# Altium schematic sheet Schematic1_1.SchDoc (part 1 of 2)
size 594 x 420 mm; SchematicName: Schematic1; PageName: 1; CmpIndex: 0; Symbol name: A2-LIST-1-GA.1; SymIndex: 2
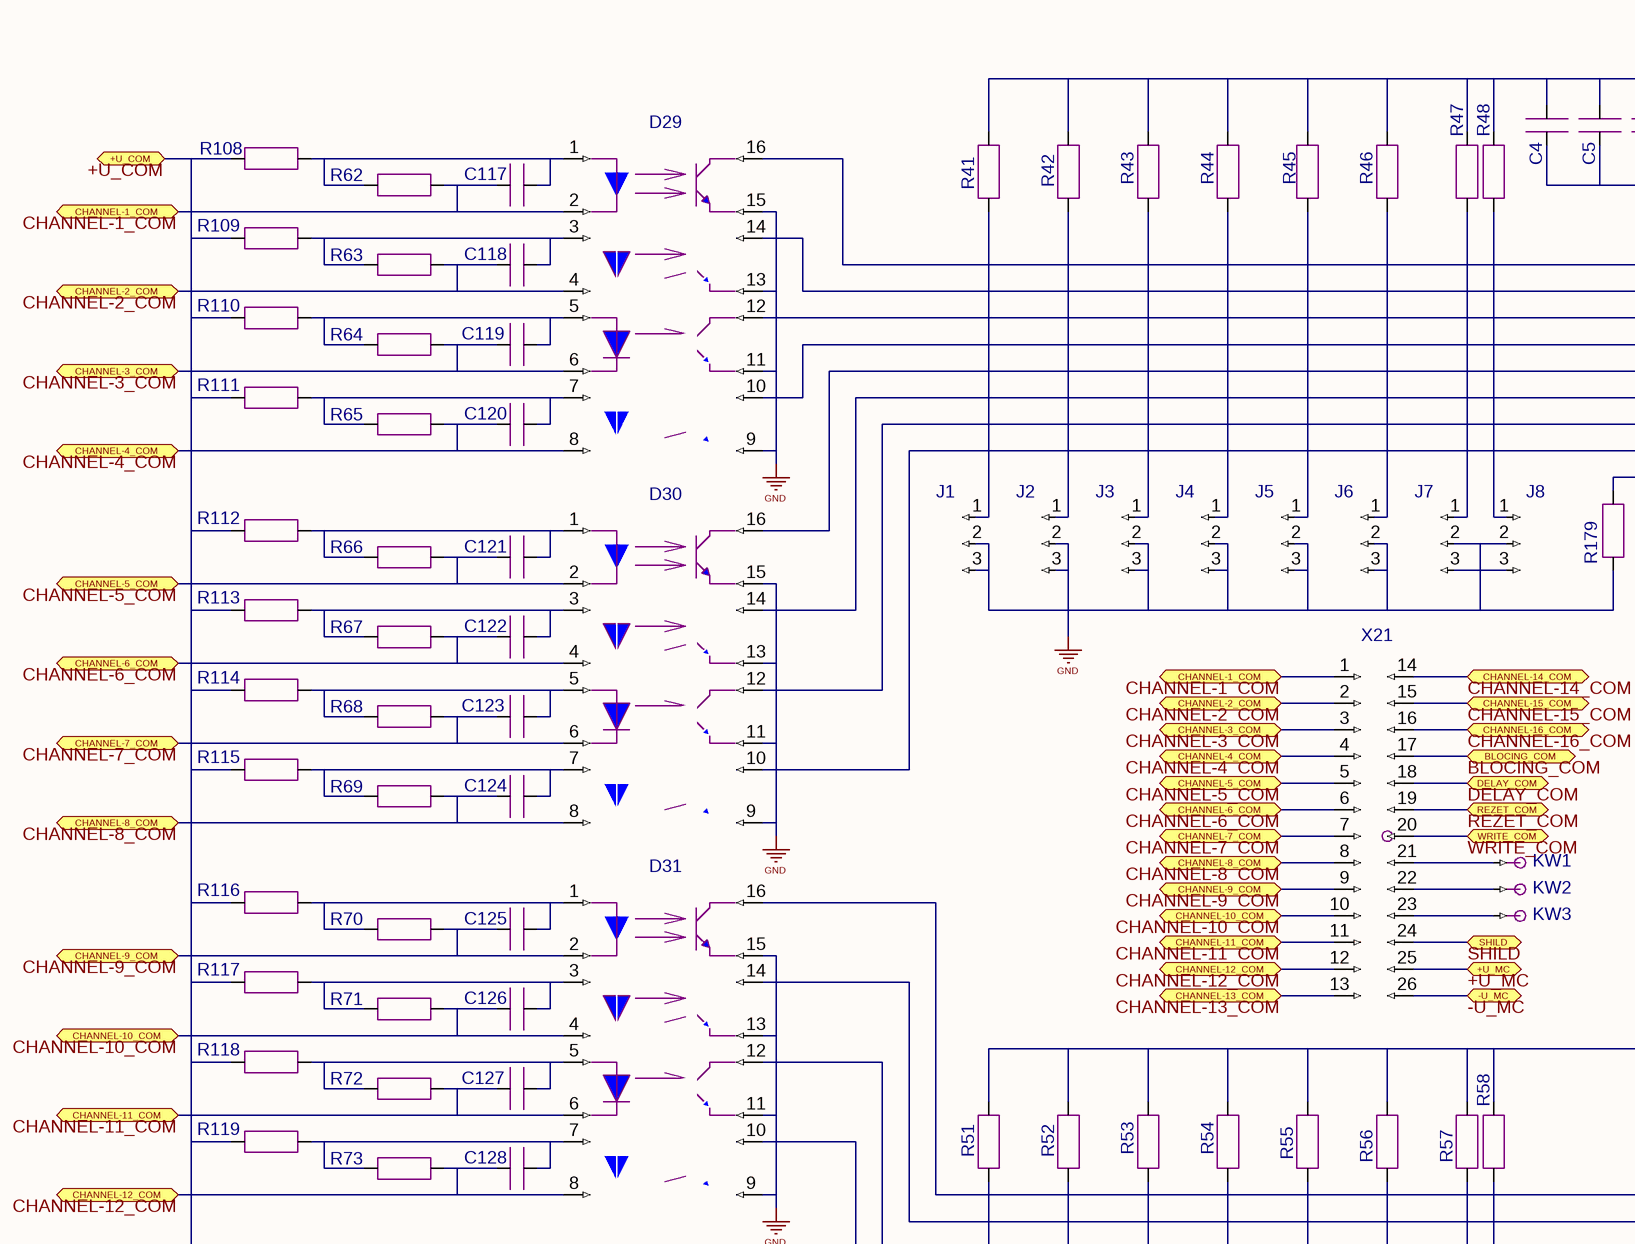
[diagram p0: Schematic1_1.SchDoc, top left]
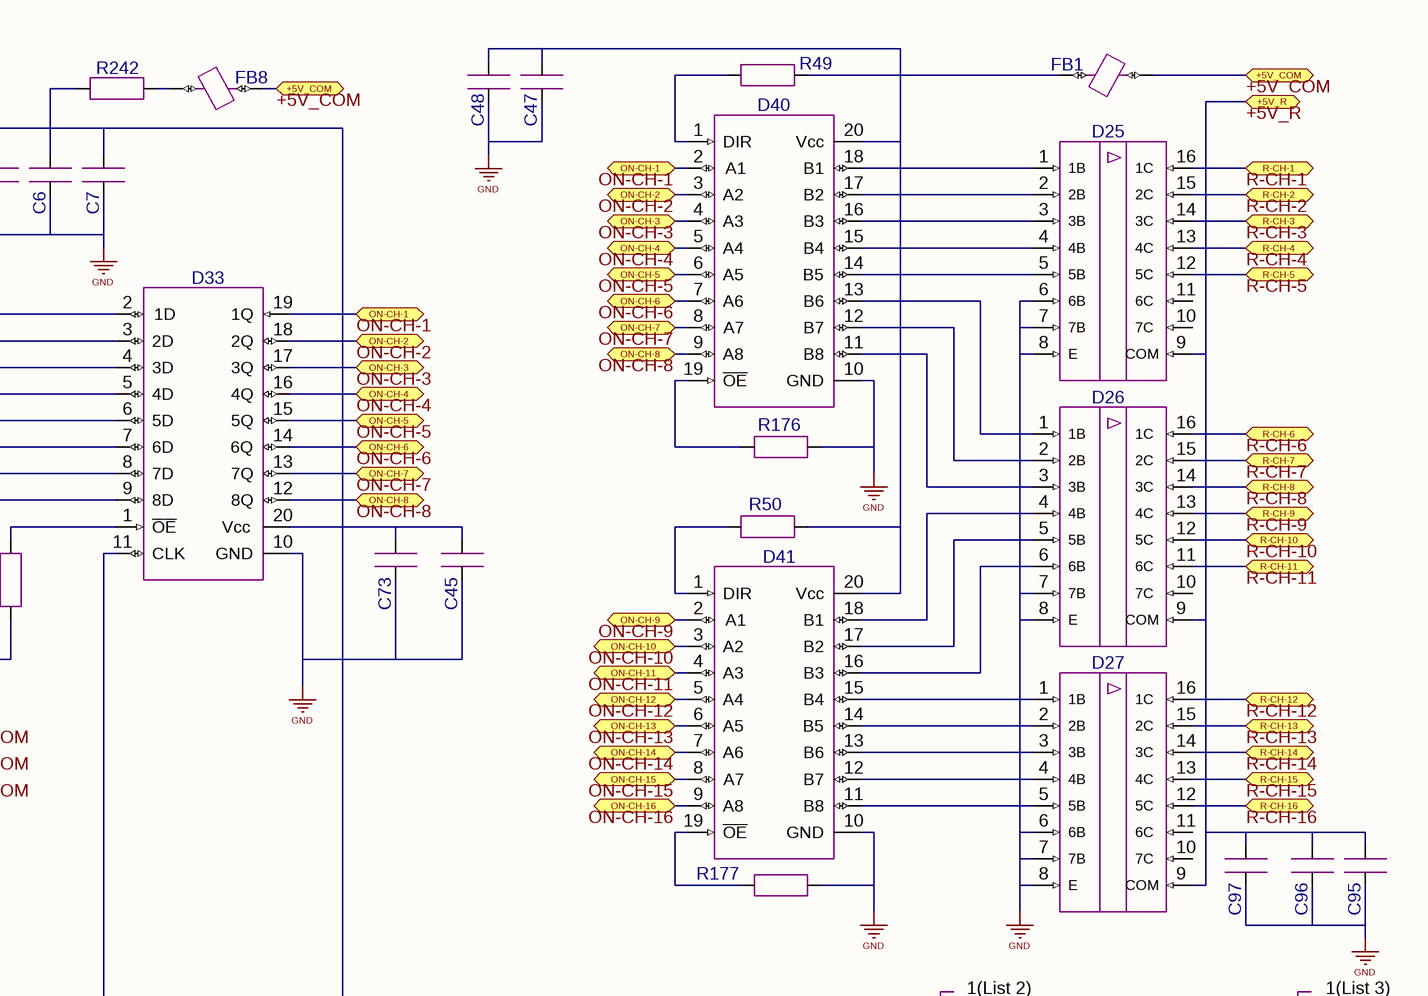
[diagram p1: Schematic1_1.SchDoc, top right]
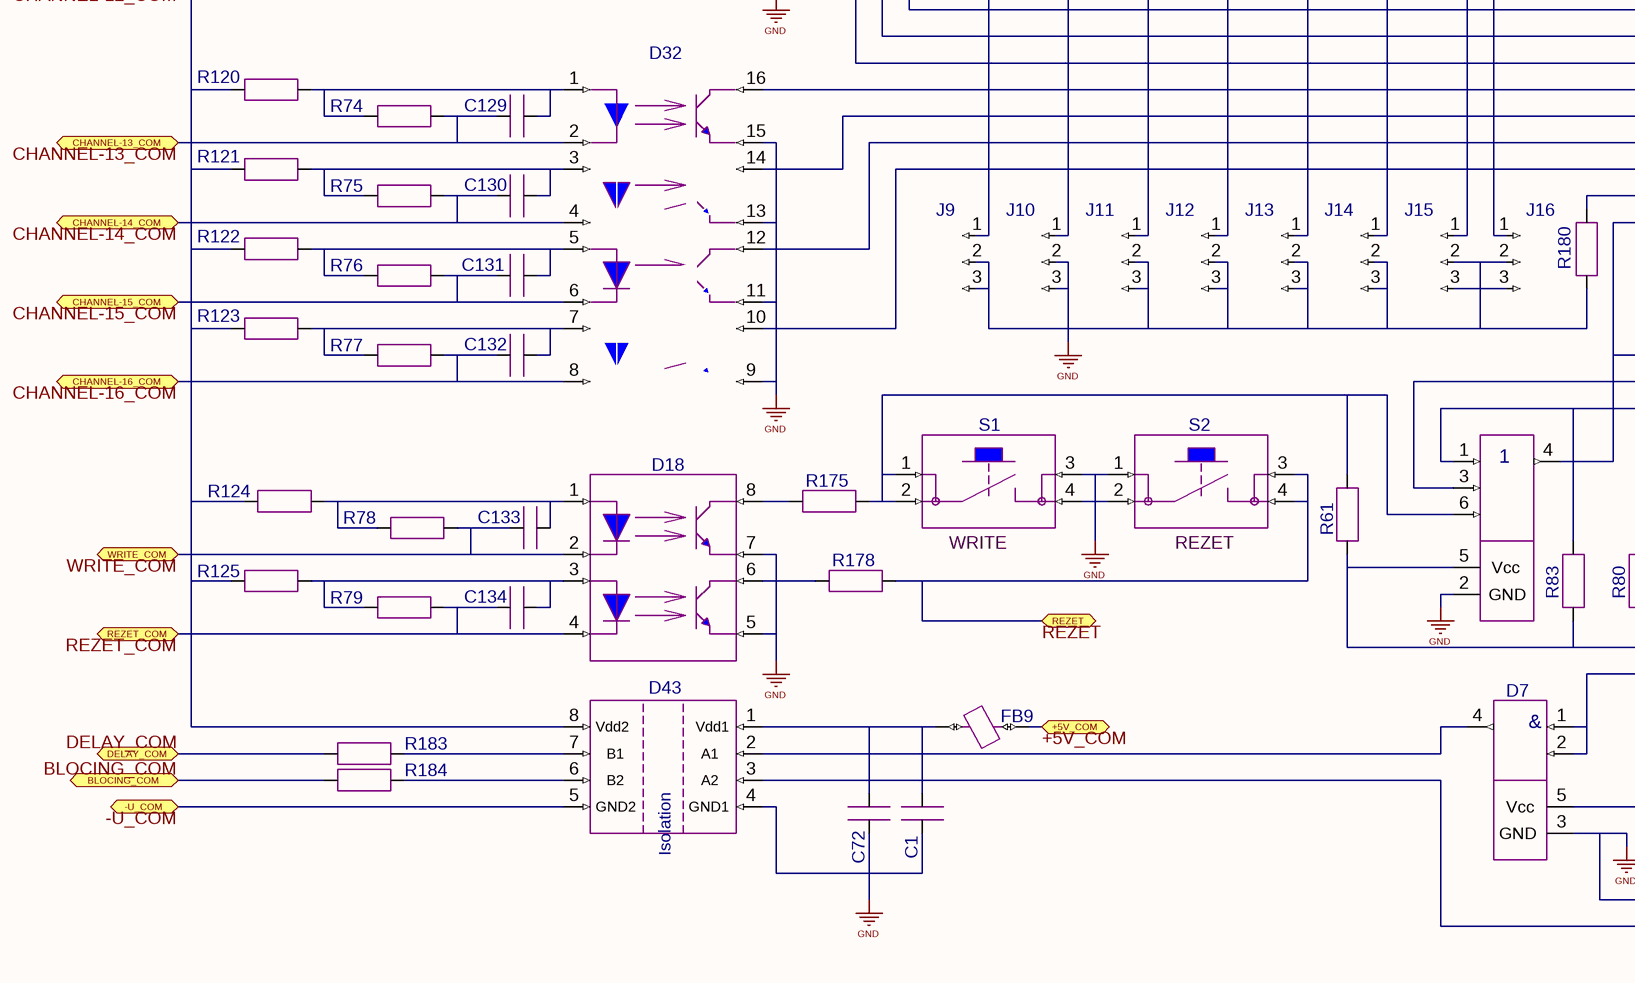
[diagram p2: Schematic1_1.SchDoc, bottom left]
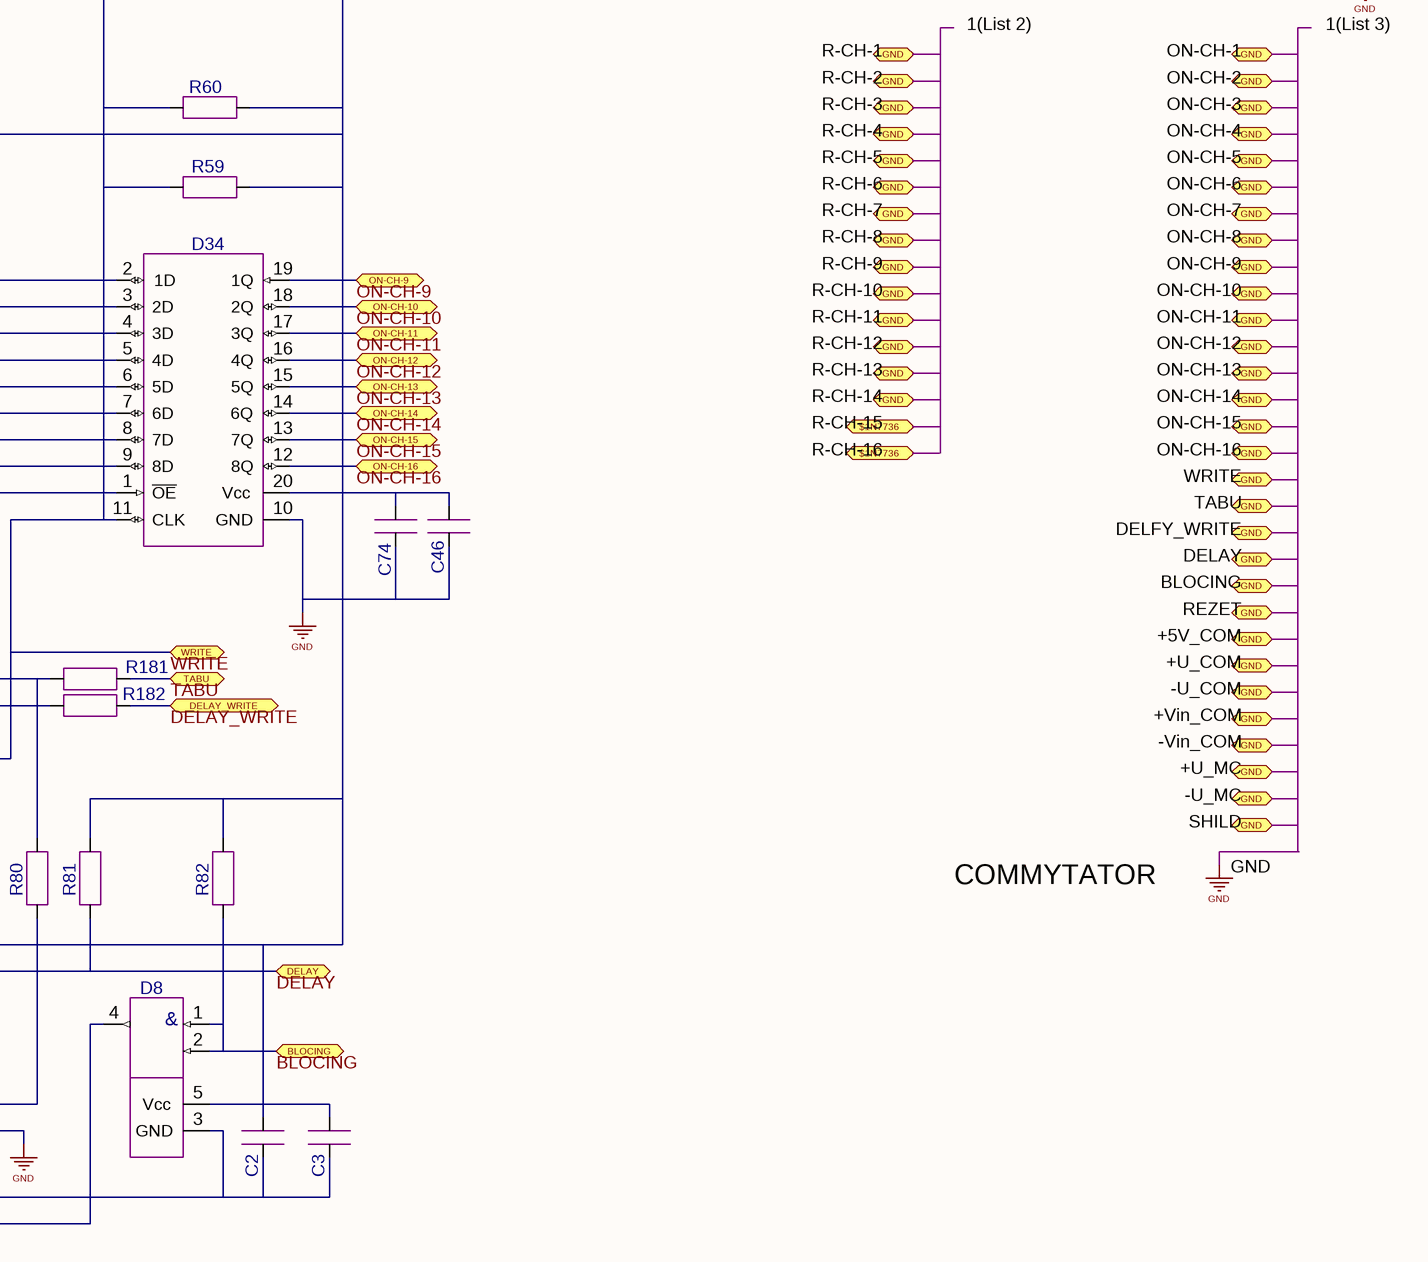
[diagram p3: Schematic1_1.SchDoc, bottom right]

## Parts
C1  CAP CER 0.1UF 50V 10% X7R 0603  (value not drawn)
C2  CAP CER 0.1UF 50V 10% X7R 0603  (value not drawn)
C3  CAP CER 0.1UF 50V 10% X7R 0603  (value not drawn)
C4  CAP CER 0.1UF 50V 10% X7R 0603  (value not drawn)
C5  CAP CER 0.1UF 50V 10% X7R 0603  (value not drawn)
C6  CAP CER 0.1UF 50V 10% X7R 0603  (value not drawn)
C7  CAP CER 0.1UF 50V 10% X7R 0603  (value not drawn)
C45  CAP CER 2.2UF 16V 10% X7R 0805  (value not drawn)
C46  CAP CER 2.2UF 16V 10% X7R 0805  (value not drawn)
C47  CAP CER 2.2UF 16V 10% X7R 0805  (value not drawn)
C48  CAP CER 2.2UF 16V 10% X7R 0805  (value not drawn)
C72  CAP CER 10UF 16V 10% X7R 0805  (value not drawn)
C73  CAP CER 10UF 16V 10% X7R 0805  (value not drawn)
C74  CAP CER 10UF 16V 10% X7R 0805  (value not drawn)
C95  CAP CER 10UF 25V 10% X7R 1210  (value not drawn)
C96  CAP CER 10UF 25V 10% X7R 1210  (value not drawn)
C97  CAP CER 10UF 25V 10% X7R 1210  (value not drawn)
C117  CAP CER 1000PF 50V 5% NP0 0603  (value not drawn)
C118  CAP CER 1000PF 50V 5% NP0 0603  (value not drawn)
C119  CAP CER 1000PF 50V 5% NP0 0603  (value not drawn)
C120  CAP CER 1000PF 50V 5% NP0 0603  (value not drawn)
C121  CAP CER 1000PF 50V 5% NP0 0603  (value not drawn)
C122  CAP CER 1000PF 50V 5% NP0 0603  (value not drawn)
C123  CAP CER 1000PF 50V 5% NP0 0603  (value not drawn)
C124  CAP CER 1000PF 50V 5% NP0 0603  (value not drawn)
C125  CAP CER 1000PF 50V 5% NP0 0603  (value not drawn)
C126  CAP CER 1000PF 50V 5% NP0 0603  (value not drawn)
C127  CAP CER 1000PF 50V 5% NP0 0603  (value not drawn)
C128  CAP CER 1000PF 50V 5% NP0 0603  (value not drawn)
C129  CAP CER 1000PF 50V 5% NP0 0603  (value not drawn)
C130  CAP CER 1000PF 50V 5% NP0 0603  (value not drawn)
C131  CAP CER 1000PF 50V 5% NP0 0603  (value not drawn)
C132  CAP CER 1000PF 50V 5% NP0 0603  (value not drawn)
C133  CAP CER 1000PF 50V 5% NP0 0603  (value not drawn)
C134  CAP CER 1000PF 50V 5% NP0 0603  (value not drawn)
D7  IC GATE AND 1CH 2-INP SOT-23-5  (value not drawn)
D8  IC GATE AND 1CH 2-INP SOT-23-5  (value not drawn)
D18  OPTOISO 2.5KV 2CH TRANS 8SOIC  (value not drawn)
D25  IC DARL TRANS ARRAY 16-SOIC  (value not drawn)
D26  IC DARL TRANS ARRAY 16-SOIC  (value not drawn)
D27  IC DARL TRANS ARRAY 16-SOIC  (value not drawn)
D29  OPTOISO 3KV 4CH TRANS 16SOIC  (value not drawn)
D30  OPTOISO 3KV 4CH TRANS 16SOIC  (value not drawn)
D31  OPTOISO 3KV 4CH TRANS 16SOIC  (value not drawn)
D32  OPTOISO 3KV 4CH TRANS 16SOIC  (value not drawn)
D33  IC D-TYPE POS TRG SNGL 20TSSOP  (value not drawn)
D34  IC D-TYPE POS TRG SNGL 20TSSOP  (value not drawn)
D40  IC BUS TRANSCEIVER DUAL 20TSSOP  (value not drawn)
D41  IC BUS TRANSCEIVER DUAL 20TSSOP  (value not drawn)
D42  IC GATE NOR 1CH 3-INP SOT-23-6  (value not drawn)
D43  IC ISOLATOR 2CH 3.75KV 8SOIC  (value not drawn)
FB1  FERRITE BEAD 1000 OHM 0,4 A 0603  (value not drawn)
FB8  FERRITE BEAD 1800 OHM 0,2 A 0603  (value not drawn)
FB9  FERRITE BEAD 1800 OHM 0,2 A 0603  (value not drawn)
J1  CONN JUMPER SHORTING .100" GOLD  (value not drawn)
J2  CONN JUMPER SHORTING .100" GOLD  (value not drawn)
J3  CONN JUMPER SHORTING .100" GOLD  (value not drawn)
J4  CONN JUMPER SHORTING .100" GOLD  (value not drawn)
J5  CONN JUMPER SHORTING .100" GOLD  (value not drawn)
J6  CONN JUMPER SHORTING .100" GOLD  (value not drawn)
J7  CONN JUMPER SHORTING .100" GOLD  (value not drawn)
J8  CONN JUMPER SHORTING .100" GOLD  (value not drawn)
J9  CONN JUMPER SHORTING .100" GOLD  (value not drawn)
J10  CONN JUMPER SHORTING .100" GOLD  (value not drawn)
J11  CONN JUMPER SHORTING .100" GOLD  (value not drawn)
J12  CONN JUMPER SHORTING .100" GOLD  (value not drawn)
J13  CONN JUMPER SHORTING .100" GOLD  (value not drawn)
J14  CONN JUMPER SHORTING .100" GOLD  (value not drawn)
J15  CONN JUMPER SHORTING .100" GOLD  (value not drawn)
J16  CONN JUMPER SHORTING .100" GOLD  (value not drawn)
KW1  MGSHV-0_12-D1_3xd0.45  (value not drawn)
KW2  MGSHV-0_12-D1_3xd0.45  (value not drawn)
KW3  MGSHV-0_12-D1_3xd0.45  (value not drawn)
R41  RES 4.70K OHM 1/10W 1% 0603 SMD  (value not drawn)
R42  RES 4.70K OHM 1/10W 1% 0603 SMD  (value not drawn)
R43  RES 4.70K OHM 1/10W 1% 0603 SMD  (value not drawn)
R44  RES 4.70K OHM 1/10W 1% 0603 SMD  (value not drawn)
R45  RES 4.70K OHM 1/10W 1% 0603 SMD  (value not drawn)
R46  RES 4.70K OHM 1/10W 1% 0603 SMD  (value not drawn)
R47  RES 4.70K OHM 1/10W 1% 0603 SMD  (value not drawn)
R48  RES 4.70K OHM 1/10W 1% 0603 SMD  (value not drawn)
R49  RES 4.70K OHM 1/10W 1% 0603 SMD  (value not drawn)
R50  RES 4.70K OHM 1/10W 1% 0603 SMD  (value not drawn)
R51  RES 4.70K OHM 1/10W 1% 0603 SMD  (value not drawn)
R52  RES 4.70K OHM 1/10W 1% 0603 SMD  (value not drawn)
R53  RES 4.70K OHM 1/10W 1% 0603 SMD  (value not drawn)
R54  RES 4.70K OHM 1/10W 1% 0603 SMD  (value not drawn)
R55  RES 4.70K OHM 1/10W 1% 0603 SMD  (value not drawn)
R56  RES 4.70K OHM 1/10W 1% 0603 SMD  (value not drawn)
R57  RES 4.70K OHM 1/10W 1% 0603 SMD  (value not drawn)
R58  RES 4.70K OHM 1/10W 1% 0603 SMD  (value not drawn)
R59  RES 4.70K OHM 1/10W 1% 0603 SMD  (value not drawn)
R60  RES 4.70K OHM 1/10W 1% 0603 SMD  (value not drawn)
R61  RES 4.70K OHM 1/10W 1% 0603 SMD  (value not drawn)
R62  RES 4.70K OHM 1/10W 1% 0603 SMD  (value not drawn)
R63  RES 4.70K OHM 1/10W 1% 0603 SMD  (value not drawn)
R64  RES 4.70K OHM 1/10W 1% 0603 SMD  (value not drawn)
R65  RES 4.70K OHM 1/10W 1% 0603 SMD  (value not drawn)
R66  RES 4.70K OHM 1/10W 1% 0603 SMD  (value not drawn)
R67  RES 4.70K OHM 1/10W 1% 0603 SMD  (value not drawn)
R68  RES 4.70K OHM 1/10W 1% 0603 SMD  (value not drawn)
R69  RES 4.70K OHM 1/10W 1% 0603 SMD  (value not drawn)
R70  RES 4.70K OHM 1/10W 1% 0603 SMD  (value not drawn)
R71  RES 4.70K OHM 1/10W 1% 0603 SMD  (value not drawn)
R72  RES 4.70K OHM 1/10W 1% 0603 SMD  (value not drawn)
R73  RES 4.70K OHM 1/10W 1% 0603 SMD  (value not drawn)
R74  RES 4.70K OHM 1/10W 1% 0603 SMD  (value not drawn)
R75  RES 4.70K OHM 1/10W 1% 0603 SMD  (value not drawn)
R76  RES 4.70K OHM 1/10W 1% 0603 SMD  (value not drawn)
R77  RES 4.70K OHM 1/10W 1% 0603 SMD  (value not drawn)
R78  RES 4.70K OHM 1/10W 1% 0603 SMD  (value not drawn)
R79  RES 4.70K OHM 1/10W 1% 0603 SMD  (value not drawn)
R80  RES 4.70K OHM 1/10W 1% 0603 SMD  (value not drawn)
R81  RES 4.70K OHM 1/10W 1% 0603 SMD  (value not drawn)
R82  RES 4.70K OHM 1/10W 1% 0603 SMD  (value not drawn)
R83  RES 4.70K OHM 1/10W 1% 0603 SMD  (value not drawn)
R108  RES 620 OHM 1/10W 1% 0603 SMD  (value not drawn)
R109  RES 620 OHM 1/10W 1% 0603 SMD  (value not drawn)
R110  RES 620 OHM 1/10W 1% 0603 SMD  (value not drawn)
R111  RES 620 OHM 1/10W 1% 0603 SMD  (value not drawn)
R112  RES 620 OHM 1/10W 1% 0603 SMD  (value not drawn)
R113  RES 620 OHM 1/10W 1% 0603 SMD  (value not drawn)
R114  RES 620 OHM 1/10W 1% 0603 SMD  (value not drawn)
R115  RES 620 OHM 1/10W 1% 0603 SMD  (value not drawn)
R116  RES 620 OHM 1/10W 1% 0603 SMD  (value not drawn)
R117  RES 620 OHM 1/10W 1% 0603 SMD  (value not drawn)
R118  RES 620 OHM 1/10W 1% 0603 SMD  (value not drawn)
R119  RES 620 OHM 1/10W 1% 0603 SMD  (value not drawn)
R120  RES 620 OHM 1/10W 1% 0603 SMD  (value not drawn)
R121  RES 620 OHM 1/10W 1% 0603 SMD  (value not drawn)
R122  RES 620 OHM 1/10W 1% 0603 SMD  (value not drawn)
R123  RES 620 OHM 1/10W 1% 0603 SMD  (value not drawn)
R124  RES 620 OHM 1/10W 1% 0603 SMD  (value not drawn)
R125  RES 620 OHM 1/10W 1% 0603 SMD  (value not drawn)
R175  RES 0.0 OHM 1/10W 0603 SMD  (value not drawn)
R176  RES 0.0 OHM 1/10W 0603 SMD  (value not drawn)
R177  RES 0.0 OHM 1/10W 0603 SMD  (value not drawn)
R178  RES 0.0 OHM 1/10W 0603 SMD  (value not drawn)
R179  RES 0.0 OHM 1/10W 0603 SMD  (value not drawn)
R180  RES 0.0 OHM 1/10W 0603 SMD  (value not drawn)
R181  RES 0.0 OHM 1/10W 0603 SMD  (value not drawn)
R182  RES 0.0 OHM 1/10W 0603 SMD  (value not drawn)
R183  RES 0.0 OHM 1/10W 0603 SMD  (value not drawn)
R184  RES 0.0 OHM 1/10W 0603 SMD  (value not drawn)
R242  RES 10.0 OHM 1/10W 1% 0603 SMD  (value not drawn)
S1  SWITCH TACTILE SPST-NO 0.1A 24V  (value not drawn)
S2  SWITCH TACTILE SPST-NO 0.1A 24V  (value not drawn)
X21  CONN HDR 2MM VERT W/SCREW 26POS  (value not drawn)

## Ports
$1N7736, +5V_COM, +5V_R, +U_COM, +U_MC, -U_COM, -U_MC, BLOCING, BLOCING_COM, CHANNEL-1_COM, CHANNEL-2_COM, CHANNEL-3_COM, CHANNEL-4_COM, CHANNEL-5_COM, CHANNEL-6_COM, CHANNEL-7_COM, CHANNEL-8_COM, CHANNEL-9_COM, CHANNEL-10_COM, CHANNEL-11_COM, CHANNEL-12_COM, CHANNEL-13_COM, CHANNEL-14_COM, CHANNEL-15_COM, CHANNEL-16_COM, DELAY, DELAY_COM, DELAY_WRITE, GND, ON-CH-1, ON-CH-2, ON-CH-3, ON-CH-4, ON-CH-5, ON-CH-6, ON-CH-7, ON-CH-8, ON-CH-9, ON-CH-10, ON-CH-11, ON-CH-12, ON-CH-13, ON-CH-14, ON-CH-15, ON-CH-16, R-CH-1, R-CH-2, R-CH-3, R-CH-4, R-CH-5, R-CH-6, R-CH-7, R-CH-8, R-CH-9, R-CH-10, R-CH-11, R-CH-12, R-CH-13, R-CH-14, R-CH-15, R-CH-16, REZET, REZET_COM, SHILD, TABU, WRITE, WRITE_COM

## Nets
GND: C1.1 C2.1 C3.1 C4.1 C5.1 C6.1 C7.1 C45.1 C46.1 C47.1 C48.1 C72.2 C73.2 C74.2 C95.1 C96.1 C97.1 D7.3(GND) D8.3(GND) D18.5(A3) D18.7(A4) D25.6(6B) D25.7(7B) D25.8(E) D26.7(7B) D26.8(E) D27.6(6B) D27.7(7B) D27.8(E) D29.9(E4) D29.11(E3) D29.13(E2) D29.15(E1) D30.9(E4) D30.11(E3) D30.13(E2) D30.15(E1) D31.9(E4) D31.11(E3) D31.13(E2) D31.15(E1) D32.9(E4) D32.11(E3) D32.13(E2) D32.15(E1) D33.10(GND) D34.10(GND) D40.10(GND) D41.10(GND) D42.2(GND) D43.4(GND1) J1.2 J1.3 J2.2 J2.3 J3.2 J3.3 J4.2 J4.3 J5.2 J5.3 J6.2 J6.3 J7.2 J7.3 J8.2 J8.3 J9.2 J9.3 J10.2 J10.3 J11.2 J11.3 J12.2 J12.3 J13.2 J13.3 J14.2 J14.3 J15.2 J15.3 J16.2 J16.3 R176.1 R177.1 R179.2 R180.2 S1.3(K2_1) S1.4(K2_2) S2.1(K1_1) S2.2(K1_2)
+5V_COM: FB1.2 FB8.1 FB9.1 ; port +5V_COM
+5V_R: C95.2 C96.2 C97.2 D25.9(COM) D26.9(COM) D27.9(COM) ; port +5V_R
+U_COM: D43.8(Vdd2) R108.1 R109.1 R110.1 R111.1 R112.1 R113.1 R114.1 R115.1 R116.1 R117.1 R118.1 R119.1 R120.1 R121.1 R122.1 R123.1 R124.1 R125.1 ; port +U_COM
+U_MC: X21.25 ; port +U_MC
-U_COM: D43.5(GND2) ; port -U_COM
-U_MC: X21.26 ; port -U_MC
BLOCING: D8.1(A) D8.2(B) R82.1 ; port BLOCING
BLOCING_COM: R184.1 X21.17 ; port BLOCING_COM
CHANNEL-1_COM: C117.2 D29.2(C1) R62.2 X21.1 ; port CHANNEL-1_COM
CHANNEL-2_COM: C118.2 D29.4(C2) R63.2 X21.2 ; port CHANNEL-2_COM
CHANNEL-3_COM: C119.2 D29.6(C3) R64.2 X21.3 ; port CHANNEL-3_COM
CHANNEL-4_COM: C120.2 D29.8(C4) R65.2 X21.4 ; port CHANNEL-4_COM
CHANNEL-5_COM: C121.2 D30.2(C1) R66.2 X21.5 ; port CHANNEL-5_COM
CHANNEL-6_COM: C122.2 D30.4(C2) R67.2 X21.6 ; port CHANNEL-6_COM
CHANNEL-7_COM: C123.2 D30.6(C3) R68.2 X21.7 ; port CHANNEL-7_COM
CHANNEL-8_COM: C124.2 D30.8(C4) R69.2 X21.8 ; port CHANNEL-8_COM
CHANNEL-9_COM: C125.2 D31.2(C1) R70.2 X21.9 ; port CHANNEL-9_COM
CHANNEL-10_COM: C126.2 D31.4(C2) R71.2 X21.10 ; port CHANNEL-10_COM
CHANNEL-11_COM: C127.2 D31.6(C3) R72.2 X21.11 ; port CHANNEL-11_COM
CHANNEL-12_COM: C128.2 D31.8(C4) R73.2 X21.12 ; port CHANNEL-12_COM
CHANNEL-13_COM: C129.2 D32.2(C1) R74.2 X21.13 ; port CHANNEL-13_COM
CHANNEL-14_COM: C130.2 D32.4(C2) R75.2 X21.14 ; port CHANNEL-14_COM
CHANNEL-15_COM: C131.2 D32.6(C3) R76.2 X21.15 ; port CHANNEL-15_COM
CHANNEL-16_COM: C132.2 D32.8(C4) R77.2 X21.16 ; port CHANNEL-16_COM
DELAY: D7.1(A) D7.2(B) R81.1 ; port DELAY
DELAY_COM: R183.1 X21.18 ; port DELAY_COM
DELAY_WRITE: R182.1 ; port DELAY_WRITE
ON-CH-1: D33.19(1Q) D40.2(A1) ; port ON-CH-1
ON-CH-2: D33.18(2Q) D40.3(A2) ; port ON-CH-2
ON-CH-3: D33.17(3Q) D40.4(A3) ; port ON-CH-3
ON-CH-4: D33.16(4Q) D40.5(A4) ; port ON-CH-4
ON-CH-5: D33.15(5Q) D40.6(A5) ; port ON-CH-5
ON-CH-6: D33.14(6Q) D40.7(A6) ; port ON-CH-6
ON-CH-7: D33.13(7Q) D40.8(A7) ; port ON-CH-7
ON-CH-8: D33.12(8Q) D40.9(A8) ; port ON-CH-8
ON-CH-9: D34.19(1Q) D41.2(A1) ; port ON-CH-9
ON-CH-10: D34.18(2Q) D41.3(A2) ; port ON-CH-10
ON-CH-11: D34.17(3Q) D41.4(A3) ; port ON-CH-11
ON-CH-12: D34.16(4Q) D41.5(A4) ; port ON-CH-12
ON-CH-13: D34.15(5Q) D41.6(A5) ; port ON-CH-13
ON-CH-14: D34.14(6Q) D41.7(A6) ; port ON-CH-14
ON-CH-15: D34.13(7Q) D41.8(A7) ; port ON-CH-15
ON-CH-16: D34.12(8Q) D41.9(A8) ; port ON-CH-16
R-CH-1: D25.16(1C) ; port R-CH-1
R-CH-2: D25.15(2C) ; port R-CH-2
R-CH-3: D25.14(3C) ; port R-CH-3
R-CH-4: D25.13(4C) ; port R-CH-4
R-CH-5: D25.12(5C) ; port R-CH-5
R-CH-6: D26.16(1C) ; port R-CH-6
R-CH-7: D26.15(2C) ; port R-CH-7
R-CH-8: D26.14(3C) ; port R-CH-8
R-CH-9: D26.13(4C) ; port R-CH-9
R-CH-10: D26.12(5C) ; port R-CH-10
R-CH-11: D26.11(6C) ; port R-CH-11
R-CH-12: D27.16(1C) ; port R-CH-12
R-CH-13: D27.15(2C) ; port R-CH-13
R-CH-14: D27.14(3C) ; port R-CH-14
R-CH-15: D27.13(4C) ; port R-CH-15
R-CH-16: D27.12(5C) ; port R-CH-16
REZET: R178.2 S2.3(K2_1) S2.4(K2_2) ; port REZET
REZET_COM: C134.2 D18.4(C2) R79.2 X21.19 ; port REZET_COM
SHILD: X21.24 ; port SHILD
TABU: R181.1 ; port TABU
WRITE: D33.11(CLK) D34.11(CLK) D42.4(Y) R59.1 R60.1 ; port WRITE
WRITE_COM: C133.2 D18.2(C1) R78.2 X21.20 ; port WRITE_COM
NetC1_2: C1.2 C72.1 D43.1(Vdd1) FB9.2
NetC2_2: C2.2 C3.2 C4.2 C5.2 C6.2 C7.2 C45.2 C46.2 C73.1 C74.1 D7.5(Vcc) D8.5(Vcc) D33.20(Vcc) D34.20(Vcc) D42.5(Vcc) R41.2 R42.2 R43.2 R44.2 R45.2 R46.2 R47.2 R48.2 R51.2 R52.2 R53.2 R54.2 R55.2 R56.2 R57.2 R58.2 R59.2 R60.2 R61.1 R80.1 R81.2 R82.2 R83.1 R242.1
NetC47_2: C47.2 C48.2 D40.20(Vcc) D41.20(Vcc) FB1.1 R49.1 R50.1
NetC117_1: C117.1 D29.1(A1) R62.1 R108.2
NetC118_1: C118.1 D29.3(A2) R63.1 R109.2
NetC119_1: C119.1 D29.5(A3) R64.1 R110.2
NetC120_1: C120.1 D29.7(A4) R65.1 R111.2
NetC121_1: C121.1 D30.1(A1) R66.1 R112.2
NetC122_1: C122.1 D30.3(A2) R67.1 R113.2
NetC123_1: C123.1 D30.5(A3) R68.1 R114.2
NetC124_1: C124.1 D30.7(A4) R69.1 R115.2
NetC125_1: C125.1 D31.1(A1) R70.1 R116.2
NetC126_1: C126.1 D31.3(A2) R71.1 R117.2
NetC127_1: C127.1 D31.5(A3) R72.1 R118.2
NetC128_1: C128.1 D31.7(A4) R73.1 R119.2
NetC129_1: C129.1 D32.1(A1) R74.1 R120.2
NetC130_1: C130.1 D32.3(A2) R75.1 R121.2
NetC131_1: C131.1 D32.5(A3) R76.1 R122.2
NetC132_1: C132.1 D32.7(A4) R77.1 R123.2
NetC133_1: C133.1 D18.1(A1) R78.1 R124.2
NetC134_1: C134.1 D18.3(A2) R79.1 R125.2
NetD7_4: D7.4(Y) D43.2(A1)
NetD8_4: D8.4(Y) D43.3(A2)
NetD18_6: D18.6(C3) R178.1
NetD18_8: D18.8(C4) R175.1
NetD25_1: D25.1(1B) D40.18(B1)
NetD25_2: D25.2(2B) D40.17(B2)
NetD25_3: D25.3(3B) D40.16(B3)
NetD25_4: D25.4(4B) D40.15(B4)
NetD25_5: D25.5(5B) D40.14(B5)
NetD26_1: D26.1(1B) D40.13(B6)
NetD26_2: D26.2(2B) D40.12(B7)
NetD26_3: D26.3(3B) D40.11(B8)
NetD26_4: D26.4(4B) D41.18(B1)
NetD26_5: D26.5(5B) D41.17(B2)
NetD26_6: D26.6(6B) D41.16(B3)
NetD27_1: D27.1(1B) D41.15(B4)
NetD27_2: D27.2(2B) D41.14(B5)
NetD27_3: D27.3(3B) D41.13(B6)
NetD27_4: D27.4(4B) D41.12(B7)
NetD27_5: D27.5(5B) D41.11(B8)
NetD29_10: D29.10(K4) D33.5(4D) J4.1 R44.1
NetD29_12: D29.12(K3) D33.4(3D) J3.1 R43.1
NetD29_14: D29.14(K2) D33.3(2D) J2.1 R42.1
NetD29_16: D29.16(K1) D33.2(1D) J1.1 R41.1
NetD30_10: D30.10(K4) D33.9(8D) J8.1 R48.1
NetD30_12: D30.12(K3) D33.8(7D) J7.1 R47.1
NetD30_14: D30.14(K2) D33.7(6D) J6.1 R46.1
NetD30_16: D30.16(K1) D33.6(5D) J5.1 R45.1
NetD31_10: D31.10(K4) D34.5(4D) J12.1 R54.1
NetD31_12: D31.12(K3) D34.4(3D) J11.1 R53.1
NetD31_14: D31.14(K2) D34.3(2D) J10.1 R52.1
NetD31_16: D31.16(K1) D34.2(1D) J9.1 R51.1
NetD32_10: D32.10(K4) D34.9(8D) J16.1 R58.1
NetD32_12: D32.12(K3) D34.8(7D) J15.1 R57.1
NetD32_14: D32.14(K2) D34.7(6D) J14.1 R56.1
NetD32_16: D32.16(K1) D34.6(5D) J13.1 R55.1
NetD33_1: D33.1(~{OE}) R179.1
NetD34_1: D34.1(~{OE}) R180.1
NetD40_1: D40.1(DIR) R49.2
NetD40_19: D40.19(~{OE}) R176.2
NetD41_1: D41.1(DIR) R50.2
NetD41_19: D41.19(~{OE}) R177.2
NetD42_1: D42.1(A) R83.2 R182.2
NetD42_3: D42.3(B) R80.2 R181.2
NetD42_6: D42.6(C) R61.2 R175.2 S1.1(K1_1) S1.2(K1_2)
NetD43_6: D43.6(B2) R184.2
NetD43_7: D43.7(B1) R183.2
NetFB8_2: FB8.2 R242.2
NetKW1_1: KW1.1 X21.21
NetKW2_1: KW2.1 X21.22
NetKW3_1: KW3.1 X21.23

Not connected (* = marked no-connect by the designer): D25 10(7C) 11(6C); D26 10(7C); D27 10(7C) 11(6C)

## Notes on the sheet
- R-CH-1
- 1(List 2)
- ON-CH-1
- 1(List 3)
- R-CH-2
- R-CH-3
- R-CH-4
- ON-CH-2
- ON-CH-3
- ON-CH-4
- R-CH-5
- R-CH-6
- ON-CH-5
- ON-CH-6
- R-CH-7
- R-CH-8
- R-CH-9
- ON-CH-7
- ON-CH-8
- ON-CH-9
- R-CH-10
- R-CH-11
- ON-CH-10
- ON-CH-11
- R-CH-12
- R-CH-13
- R-CH-14
- ON-CH-12
- ON-CH-13
- ON-CH-14
- R-CH-15
- R-CH-16
- ON-CH-15
- ON-CH-16
- WRITE
- TABU
- DELFY_WRITE
- DELAY
- BLOCING
- REZET
- +5V_COM
- +U_COM
- -U_COM
- +Vin_COM
- -Vin_COM
- +U_MC
- -U_MC
- (near S1) WRITE
- (near S2) REZET
- COMMYTATOR
- SHILD
- GND
- Labels drawn without touching a wire or pin: GND
- (in symbol IC GATE AND 1CH 2-INP SOT-23-5) &
- (in symbol IC ISOLATOR 2CH 3.75KV 8SOIC) Isolation